# Altium schematic sheet Photodiode.SchDoc
size 420 x 297 mm; Address1: Address1; Address2: Address2; Address3: Address3; Address4: Address4; DocumentNumber: *Э3; SheetNumber: 2; SheetTotal: 11; DocumentType: Схема электрическая *
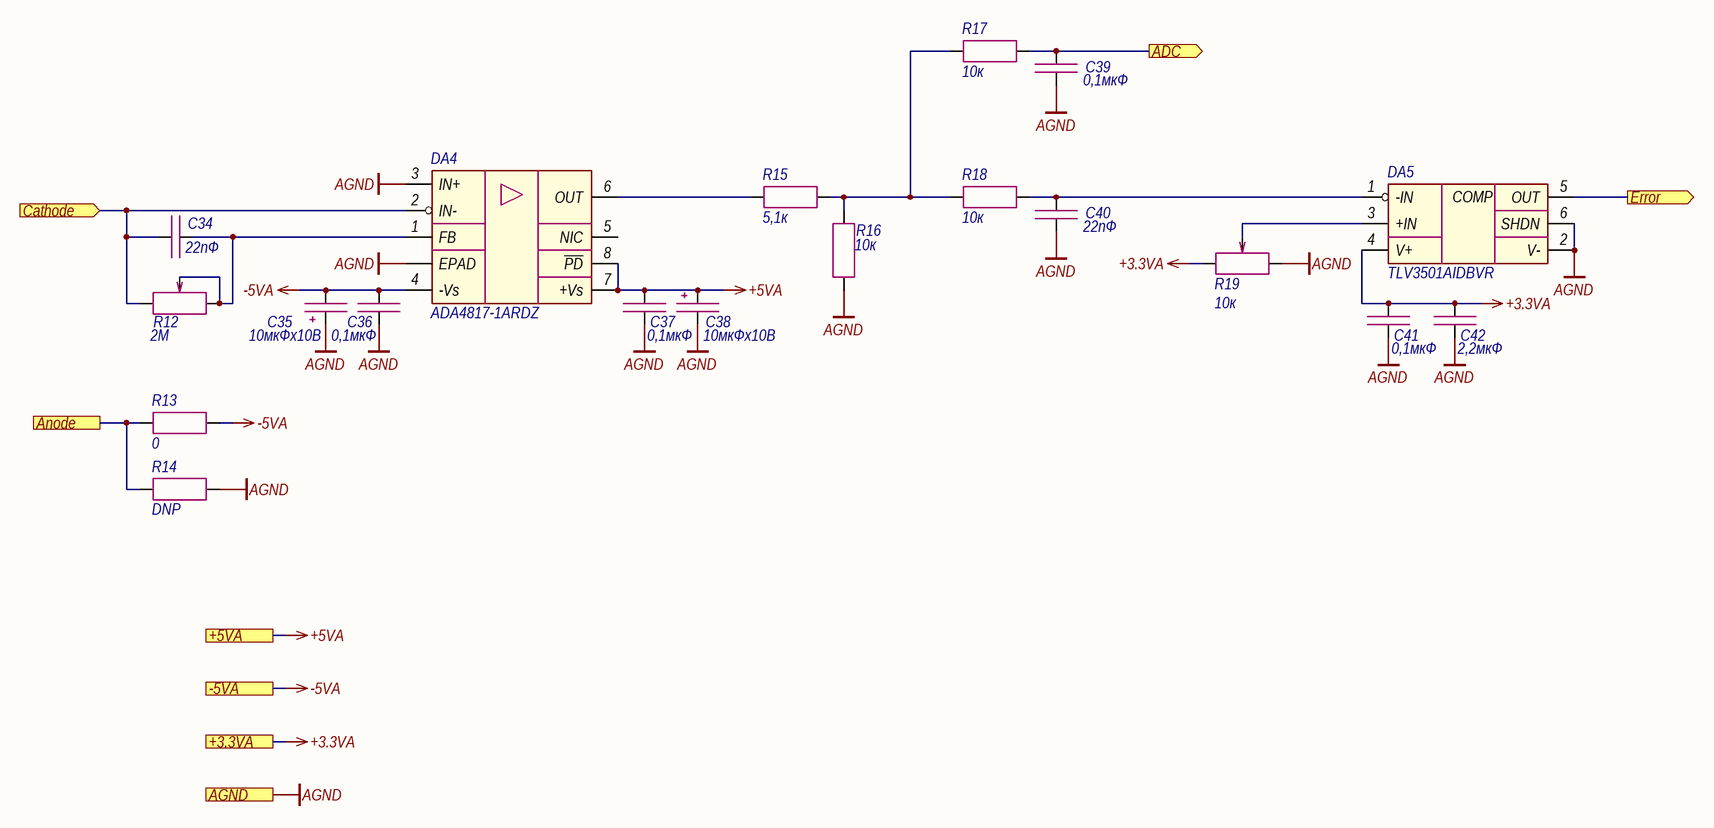
[diagram p0: Photodiode.SchDoc]

## Parts
C34  22пФ  [CAP_0603]
C35  10мкФх10B  [CAP_A]
C36  0,1мкФ  [CAP_0603]
C37  0,1мкФ  [CAP_0603]
C38  10мкФх10B  [CAP_A]
C39  0,1мкФ  [CAP_0603]
C40  22пФ  [CAP_0603]
C41  0,1мкФ  [CAP_0603]
C42  2,2мкФ  [CAP_0603]
DA4  ADA4817-1ARDZ  [SOIC-8 EPAD]
DA5  TLV3501AIDBVR  [SOT-23-6]
R12  2М  [3224W]
R13  0  [RES_0603]
R14  DNP  [RES_0603]
R15  5,1к  [RES_0603]
R16  10к  [RES_0603]
R17  10к  [RES_0603]
R18  10к  [RES_0603]
R19  10к  [3224W]

## Ports
+3.3VA (see Main[2A], Thermistor[2C]), +5VA (see Main[1A], Hardwiring[4D], LD_driver[1D]), -5VA (see Main[1A]), ADC (out, see Main[2A]), AGND (see Main[2A], Hardwiring[4D], LD_driver[1D], Thermistor[2C]), Anode (see Main[1A]), Cathode (in, see Main[1A]), Error (out, see Main[2A])

## Nets
+3.3VA: C41.1 C42.1 DA5.4(V+) R19.3 ; port +3.3VA
+5VA: C37.1 C38.1 DA4.7(+Vs) DA4.8(~{PD}) ; port +5VA
-5VA: C35.2 C36.1 DA4.4(-Vs) R13.1 ; port -5VA
AGND: C35.1 C36.2 C37.2 C38.2 C39.2 C40.2 C41.2 C42.2 DA4.3(IN+) DA4.EPAD DA5.2(V-) DA5.6(SHDN) R14.2 R16.2 R19.1 ; port AGND
ADC: C39.1 R17.2 ; port ADC
Anode: R13.2 R14.1 ; port Anode
Cathode: C34.2 DA4.2(IN-) R12.1 ; port Cathode
Error: DA5.5(OUT) ; port Error
NetC34_1: C34.1 DA4.1(FB) R12.2 R12.3
NetC40_1: C40.1 DA5.1(-IN) R18.2
NetDA4_6: DA4.6(OUT) R15.1
NetDA5_3: DA5.3(+IN) R19.2
NetR15_2: R15.2 R16.1 R17.1 R18.1

Not connected (* = marked no-connect by the designer): DA4 5(NIC)

## Notes on the sheet
- Подп. и дата
- Инв. № дубл.
- Взам. инв. №
- Инв. № подл.
- Изм.
- Лист
- № докум.
- Подп.
- Дата
- Копировал
- Формат А3
- (in symbol TLV3501) COMP

## Library data of the parts
C34 C40 = Capacitor: Manufacturer: Murata; Model: GRM1885C1H220JA01D; Value: 22пФ; Document: *
C35 C38 = Capacitor_Polar: Model: TECAP, 10 мкФ, 10 В, тип A, 10%; Value: 10мкФх10B; Document: *; Manufacturer: *
C36 C37 C39 C41 = Capacitor: Manufacturer: Murata; Model: GRM188R71H104KA93D; Value: 0,1мкФ; Document: *
C42 = Capacitor: Manufacturer: Murata; Model: GRM188R61H225KE11D; Value: 2,2мкФ; Document: *
DA4 = ADA4817-1ARDZ: Manufacturer: Analog Devices; Model: ADA4817-1ARDZ; Document: *
DA5 = TLV3501: Manufacturer: Texas Instruments; Model: TLV3501AIDBVR; Document: *
R12 = Resistor_Variable: Manufacturer: Bourns; Model: 3224W-1-205E; Value: 2М; Document: *
R13 = Resistor: Manufacturer: Yageo; Model: RC0603FR-070RL; Value: 0; Document: *
R14 = Resistor: Value: DNP; Model: DNP; Document: *; Manufacturer: *
R15 = Resistor: Manufacturer: Yageo; Model: RC0603FR-075K1L; Value: 5,1к; Document: *
R16-R18 = Resistor: Manufacturer: Yageo; Model: RC0603FR-0710KL; Value: 10к; Document: *
R19 = Resistor_Variable: Manufacturer: Bourns; Model: 3224W-1-103; Value: 10к; Document: *